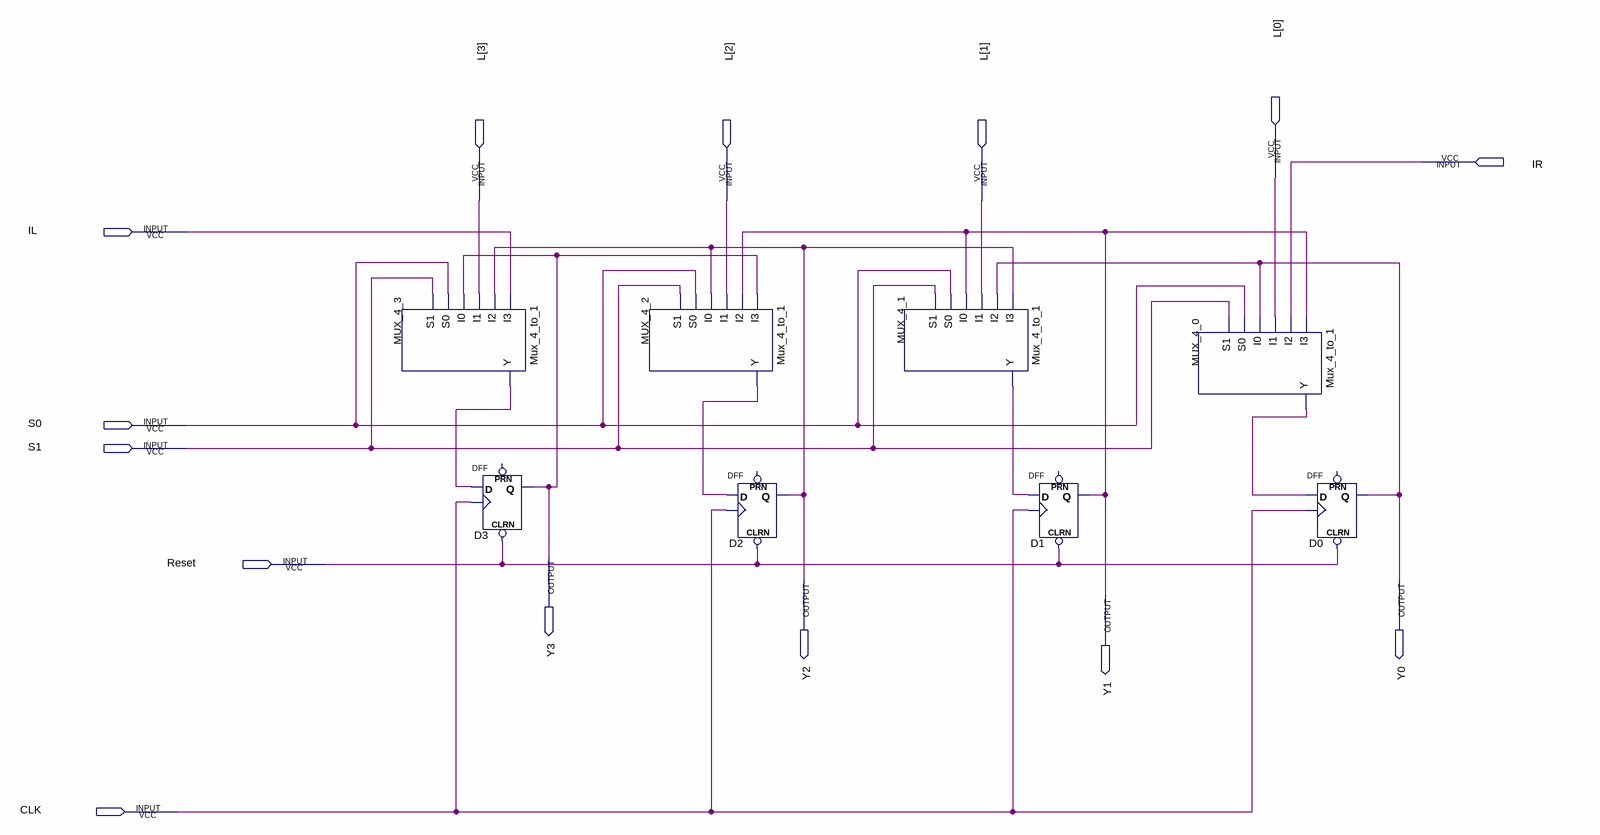
[diagram p0: schematic sheet]
// Quartus schematic Thanh_ghi_nap_SS.bdf as structural Verilog: 8 symbols, 14 pins
module Thanh_ghi_nap_SS (
  input  IR,
  input  [3:0] L,
  input  IL,
  input  S0,
  input  S1,
  input  Reset,
  input  CLK,
  output Y3,
  output Y2,
  output Y0,
  output Y1
);

  wire MUX_4_0_y, MUX_4_1_y, MUX_4_2_y, MUX_4_3_y;

  Mux_4_to_1 MUX_4_3 (.I3(IL), .I2(Y2), .I1(L[3]), .I0(Y3), .S0(S0), .S1(S1), .Y(MUX_4_3_y));
  DFF D3 (.CLRN(Reset), .CLK(CLK), .D(MUX_4_3_y), .Q(Y3));  // open: PRN
  Mux_4_to_1 MUX_4_2 (.I3(Y3), .I2(Y1), .I1(L[2]), .I0(Y2), .S0(S0), .S1(S1), .Y(MUX_4_2_y));
  DFF D2 (.CLRN(Reset), .CLK(CLK), .D(MUX_4_2_y), .Q(Y2));  // open: PRN
  Mux_4_to_1 MUX_4_1 (.I3(Y2), .I2(Y0), .I1(L[1]), .I0(Y1), .S0(S0), .S1(S1), .Y(MUX_4_1_y));
  DFF D1 (.CLRN(Reset), .CLK(CLK), .D(MUX_4_1_y), .Q(Y1));  // open: PRN
  Mux_4_to_1 MUX_4_0 (.I3(Y1), .I2(IR), .I1(L[0]), .I0(Y0), .S0(S0), .S1(S1), .Y(MUX_4_0_y));
  DFF D0 (.CLRN(Reset), .CLK(CLK), .D(MUX_4_0_y), .Q(Y0));  // open: PRN
endmodule
